# Altium schematic sheet S56_MLD_tiny_Controller.SchDoc
size A4; SheetNumber: 3; SheetTotal: 3
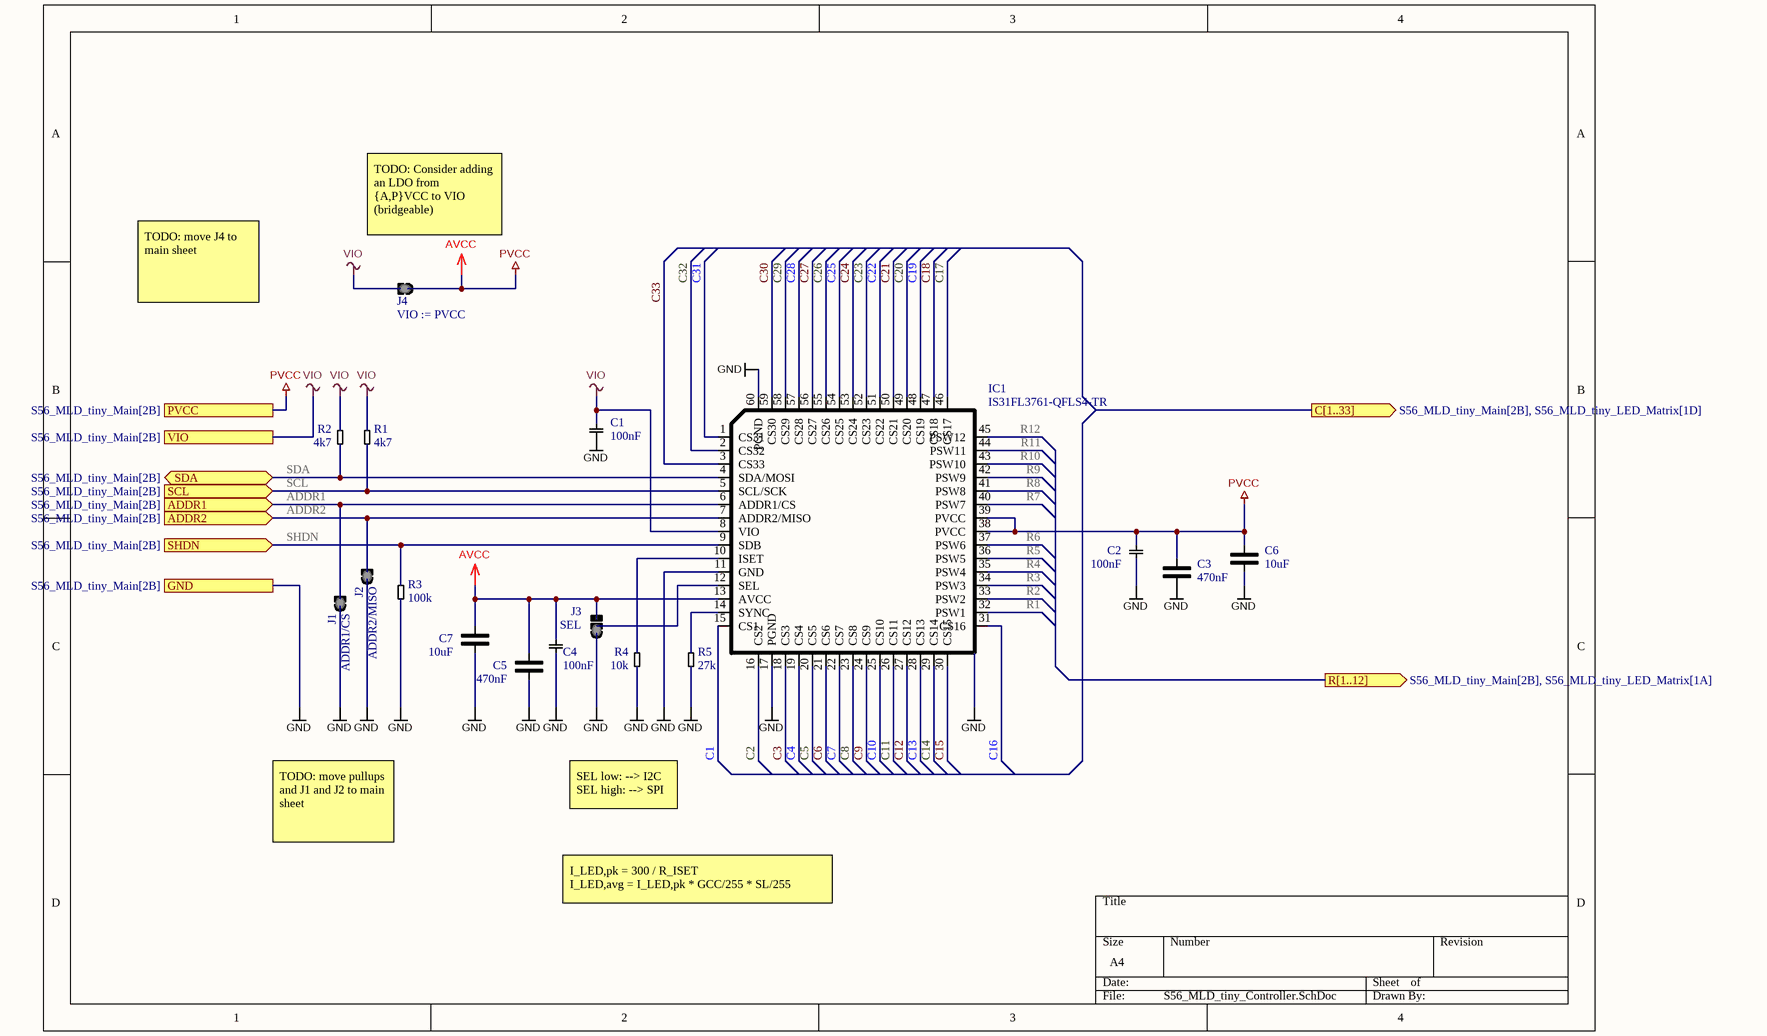
[diagram p0: S56_MLD_tiny_Controller.SchDoc]

## Parts
C1  100nF  [C0402G]
C2  100nF  [C0402G]
C3  470nF  [C0603G]
C4  100nF  [C0402G]
C5  470nF  [C0603G]
C6  10uF  [C0805G]
C7  10uF  [C0805G]
IC1  IS31FL3761-QFLS4-TR  [QFN40P700X700X80_HS-61N]
J1  ADDR1/CS  [R0402G]
J2  ADDR2/MISO  [R0402G]
J3  SEL  [JUMP_2W_0402]
J4  VIO := PVCC  [JUMP_1W_0603_SOLDER]
R1  4k7  [R0402G]
R2  4k7  [R0402G]
R3  100k  [R0402G]
R4  10k  [R0402G]
R5  27k  [R0402G]

## Ports
ADDR1 (in, see S56_MLD_tiny_Main[2B]), ADDR2 (in, see S56_MLD_tiny_Main[2B]), C[1..33] (out, see S56_MLD_tiny_Main[2B], S56_MLD_tiny_LED_Matrix[1D]), GND (see S56_MLD_tiny_Main[2B]), PVCC (see S56_MLD_tiny_Main[2B]), R[1..12] (out, see S56_MLD_tiny_Main[2B], S56_MLD_tiny_LED_Matrix[1A]), SCL (in, see S56_MLD_tiny_Main[2B]), SDA (bidir, see S56_MLD_tiny_Main[2B]), SHDN (in, see S56_MLD_tiny_Main[2B]), VIO (see S56_MLD_tiny_Main[2B])

## Nets
AVCC: C2.2 C3.2 C4.2 C5.2 C6.2 C7.2 IC1.13(AVCC) IC1.38(PVCC) IC1.39(PVCC) J3.3 J4.1 ; port PVCC  [also labelled PVCC]
GND: C1.2 C2.1 C3.1 C4.1 C5.1 C6.1 C7.1 IC1.11(GND) IC1.17(PGND) IC1.60(PGND) IC1.61(GND) J1.1 J2.1 J3.1 R3.1 R4.1 R5.1 ; port GND
VIO: C1.1 IC1.8(VIO) J4.2 R1.2 R2.2 ; port VIO
ADDR1: IC1.6(ADDR1/CS) J1.2 ; port ADDR1
ADDR2: IC1.7(ADDR2/MISO) J2.2 ; port ADDR2
C1: IC1.15(CS1)
C2: IC1.16(CS2)
C3: IC1.18(CS3)
C4: IC1.19(CS4)
C5: IC1.20(CS5)
C6: IC1.21(CS6)
C7: IC1.22(CS7)
C8: IC1.23(CS8)
C9: IC1.24(CS9)
C10: IC1.25(CS10)
C11: IC1.26(CS11)
C12: IC1.27(CS12)
C13: IC1.28(CS13)
C14: IC1.29(CS14)
C15: IC1.30(CS15)
C16: IC1.31(CS16)
C17: IC1.46(CS17)
C18: IC1.47(CS18)
C19: IC1.48(CS19)
C20: IC1.49(CS20)
C21: IC1.50(CS21)
C22: IC1.51(CS22)
C23: IC1.52(CS23)
C24: IC1.53(CS24)
C25: IC1.54(CS25)
C26: IC1.55(CS26)
C27: IC1.56(CS27)
C28: IC1.57(CS28)
C29: IC1.58(CS29)
C30: IC1.59(CS30)
C31: IC1.1(CS31)
C32: IC1.2(CS32)
C33: IC1.3(CS33)
R1: IC1.32(PSW1)
R2: IC1.33(PSW2)
R3: IC1.34(PSW3)
R4: IC1.35(PSW4)
R5: IC1.36(PSW5)
R6: IC1.37(PSW6)
R7: IC1.40(PSW7)
R8: IC1.41(PSW8)
R9: IC1.42(PSW9)
R10: IC1.43(PSW10)
R11: IC1.44(PSW11)
R12: IC1.45(PSW12)
SCL: IC1.5(SCL/SCK) R1.1 ; port SCL
SDA: IC1.4(SDA/MOSI) R2.1 ; port SDA
SHDN: IC1.9(SDB) R3.2 ; port SHDN
NetIC1_10: IC1.10(ISET) R4.2
NetIC1_12: IC1.12(SEL) J3.2
NetIC1_14: IC1.14(SYNC) R5.2

Not connected (* = marked no-connect by the designer): IC1 0(HEAT_SLUG)

## Notes on the sheet
- TODO: Consider adding an LDO from {A,P}VCC to VIO (bridgeable)
- TODO: move J4 to main sheet
- TODO: move pullups and J1 and J2 to main sheet
- SEL low: --> I2C
  SEL high: --> SPI
- I_LED,pk = 300 / R_ISET
  I_LED,avg = I_LED,pk * GCC/255 * SL/255

## Library data of the parts
C1 C2 C4 = CAP10: Capacitor, unipolar; Value: 100nF
C3 C5 = CAP20L: Capacitor, unipolar; Part: KAM15BR71E474KT; Manufacturer: KYOCERA AVX; Value: 470nF; Digikey: 478-KAM15BR71E474KTCT-ND
C6 C7 = CAP20L: Capacitor, unipolar; Part: CL21A106KOQNNNE; Manufacturer: Samsung Electro-Mechanics; Value: 10uF; Digikey: 1276-1096-1-ND
IC1 = IS31FL3761: IS31FL3761 in QFN-60; Manufacturer: Lumissil Microsystems; Part: IS31FL3761-QFLS4-TR; Digikey: 2521-IS31FL3761-QFLS4-TRCT-ND
J1 J2 J4 = JUMP_1WAY_SMD_HAT_SET
J3 = JUMP_2WAY_SMD_HAT_SET1
R1-R5 = RES10_: Resistor
  R1 R2: Value: 4k7
  R3: Value: 100k
  R4: Value: 10k
  R5: Value: 27k